# Altium schematic sheet FMU MCU.SchDoc: FMU IO
size 420 x 297 mm; CheckedBy: Le Huynh Phat Tai; DrawnBy: Le Huynh Phat Tai; Engineer: Le Huynh Phat Tai; SheetNumber: 1; SheetTotal: 5
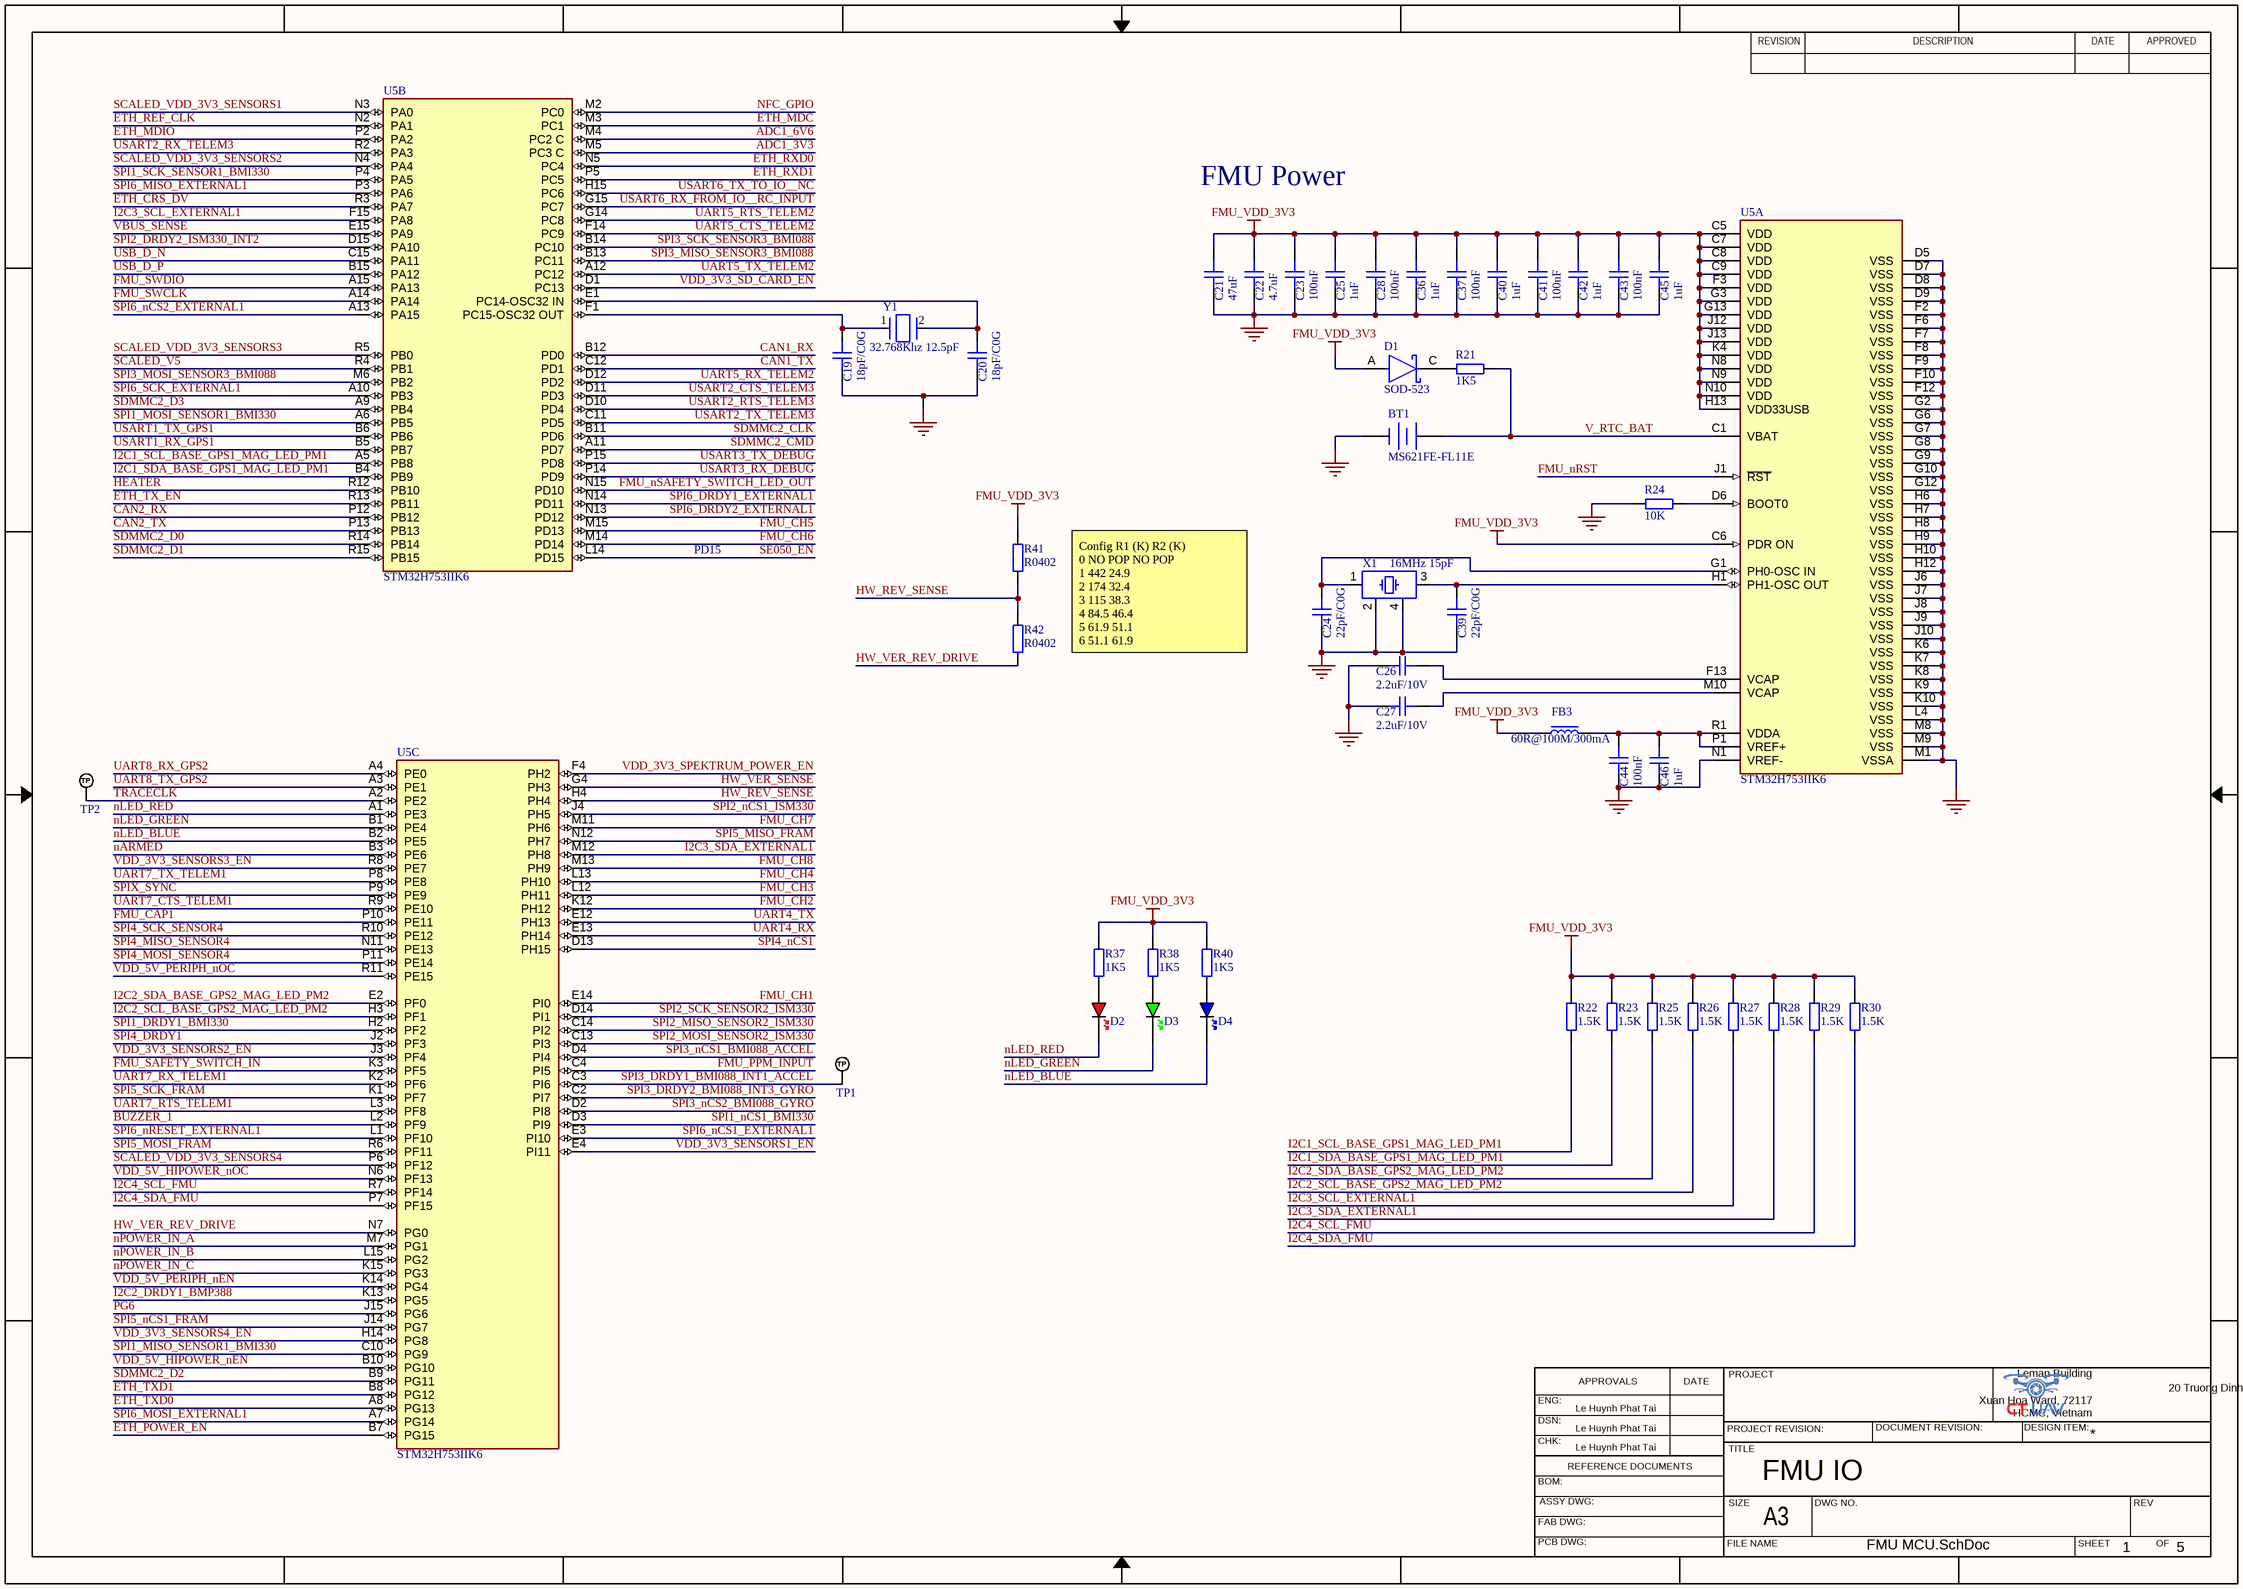
[diagram p0: FMU MCU.SchDoc]

## Parts
BT1  MS621FE-FL11E  [MS621R]
C19  18pF/C0G  [CAPC1005X05N]
C20  18pF/C0G  [CAPC1005X05N]
C21  47uF  [CAPC2012X14N]
C22  4.7uF  [CAPC1608X10N]
C23  100nF  [CAPC1005X05N]
C24  22pF/C0G  [CAPC1005X05N]
C25  1uF  [CAPC1005X05N]
C26  2.2uF/10V  [CAPC1608X10N]
C27  2.2uF/10V  [CAPC1608X10N]
C28  100nF  [CAPC1005X05N]
C36  1uF  [CAPC1005X05N]
C37  100nF  [CAPC1005X05N]
C39  22pF/C0G  [CAPC1005X05N]
C40  1uF  [CAPC1005X05N]
C41  100nF  [CAPC1005X05N]
C42  1uF  [CAPC1005X05N]
C43  100nF  [CAPC1005X05N]
C44  100nF  [CAPC1005X05N]
C45  1uF  [CAPC1005X05N]
C46  1uF  [CAPC1005X05N]
D1  SOD-523  [SODFL160X70-2N]
D2  RED  [LED_0603_RED]  (value not drawn)
D3  GREEN  [LED_0603_GREEN]  (value not drawn)
D4  BLUE  [LED_0603_BLUE]  (value not drawn)
FB3  60R@100M/300mA  [INDC1005X06N]
R21  1K5  [RESC1005X04N]
R22  1.5K  [RESC1005X04N]
R23  1.5K  [RESC1005X04N]
R24  10K  [RESC1005X04N]
R25  1.5K  [RESC1005X04N]
R26  1.5K  [RESC1005X04N]
R27  1.5K  [RESC1005X04N]
R28  1.5K  [RESC1005X04N]
R29  1.5K  [RESC1005X04N]
R30  1.5K  [RESC1005X04N]
R37  1K5  [RESC1005X04N]
R38  1K5  [RESC1005X04N]
R40  1K5  [RESC1005X04N]
R41  R0402  [RESC1005X04N]
R42  R0402  [RESC1005X04N]
TP1  TP_NOBOM  [PAD_RND_1MM]  (value not drawn)  (no BOM)
TP2  TP_NOBOM  [PAD_RND_1MM]  (value not drawn)  (no BOM)
U5  STM32H753IIK6  [BGA176C65P15X15_1000X1000X60N]  (parts A,B,C of 3)
X1  16MHz 15pF  [OSCCC320X250X80]
Y1  32.768Khz 12.5pF  [XTAL3215X80N-2N]

## Nets
FMU_VDD_3V3: C21.2 C22.2 C23.2 C25.2 C28.2 C36.2 C37.2 C40.2 C41.2 C42.2 C43.2 C45.2 D1.A FB3.1 R22.2 R23.2 R25.2 R26.2 R27.2 R28.2 R29.2 R30.2 R37.1 R38.1 R40.1 R41.1 U5.C5(VDD) U5.C6(PDR_ON) U5.C7(VDD) U5.C8(VDD) U5.C9(VDD) U5.F3(VDD) U5.G3(VDD) U5.G13(VDD) U5.H13(VDD33USB) U5.J12(VDD) U5.J13(VDD) U5.K4(VDD) U5.N8(VDD) U5.N9(VDD) U5.N10(VDD)
GND: BT1.2(-) C19.1 C20.1 C21.1 C22.1 C23.1 C24.1 C25.1 C26.2 C27.1 C28.1 C36.1 C37.1 C39.1 C40.1 C41.1 C42.1 C43.1 C44.1 C45.1 C46.1 R24.1 U5.D5(VSS) U5.D7(VSS) U5.D8(VSS) U5.D9(VSS) U5.F2(VSS) U5.F6(VSS) U5.F7(VSS) U5.F8(VSS) U5.F9(VSS) U5.F10(VSS) U5.F12(VSS) U5.G2(VSS) U5.G6(VSS) U5.G7(VSS) U5.G8(VSS) U5.G9(VSS) U5.G10(VSS) U5.G12(VSS) U5.H6(VSS) U5.H7(VSS) U5.H8(VSS) U5.H9(VSS) U5.H10(VSS) U5.H12(VSS) U5.J6(VSS) U5.J7(VSS) U5.J8(VSS) U5.J9(VSS) U5.J10(VSS) U5.K6(VSS) U5.K7(VSS) U5.K8(VSS) U5.K9(VSS) U5.K10(VSS) U5.L4(VSS) U5.M1(VSSA) U5.M8(VSS) U5.M9(VSS) U5.N1(VREF-) X1.2 X1.4
ADC1_3V3: U5.M5(PC3_C)
ADC1_6V6: U5.M4(PC2_C)
BUZZER_1: U5.L2(PF9)
CAN1_RX: U5.B12(PD0)
CAN1_TX: U5.C12(PD1)
CAN2_RX: U5.P12(PB12)
CAN2_TX: U5.P13(PB13)
ETH_CRS_DV: U5.R3(PA7)
ETH_MDC: U5.M3(PC1)
ETH_MDIO: U5.P2(PA2)
ETH_POWER_EN: U5.B7(PG15)
ETH_REF_CLK: U5.N2(PA1)
ETH_RXD0: U5.N5(PC4)
ETH_RXD1: U5.P5(PC5)
ETH_TX_EN: U5.R13(PB11)
ETH_TXD0: U5.A8(PG13)
ETH_TXD1: U5.B8(PG12)
FMU_CAP1: U5.P10(PE11)
FMU_CH1: U5.E14(PI0)
FMU_CH2: U5.K12(PH12)
FMU_CH3: U5.L12(PH11)
FMU_CH4: U5.L13(PH10)
FMU_CH5: U5.M15(PD13)
FMU_CH6: U5.M14(PD14)
FMU_CH7: U5.M11(PH6)
FMU_CH8: U5.M13(PH9)
FMU_nRST: U5.J1(~{RST})
FMU_nSAFETY_SWITCH_LED_OUT: U5.N15(PD10)
FMU_PPM_INPUT: U5.C4(PI5)
FMU_SAFETY_SWITCH_IN: U5.K3(PF5)
FMU_SWCLK: U5.A14(PA14)
FMU_SWDIO: U5.A15(PA13)
HEATER: U5.R12(PB10)
HW_REV_SENSE: R41.2 R42.1 U5.H4(PH4)
HW_VER_REV_DRIVE: R42.2 U5.N7(PG0)
HW_VER_SENSE: U5.G4(PH3)
I2C1_SCL_BASE_GPS1_MAG_LED_PM1: R22.1 U5.A5(PB8)
I2C1_SDA_BASE_GPS1_MAG_LED_PM1: R23.1 U5.B4(PB9)
I2C2_DRDY1_BMP388: U5.K13(PG5)
I2C2_SCL_BASE_GPS2_MAG_LED_PM2: R26.1 U5.H3(PF1)
I2C2_SDA_BASE_GPS2_MAG_LED_PM2: R25.1 U5.E2(PF0)
I2C3_SCL_EXTERNAL1: R27.1 U5.F15(PA8)
I2C3_SDA_EXTERNAL1: R28.1 U5.M12(PH8)
I2C4_SCL_FMU: R29.1 U5.R7(PF14)
I2C4_SDA_FMU: R30.1 U5.P7(PF15)
nARMED: U5.B3(PE6)
NFC_GPIO: U5.M2(PC0)
nLED_BLUE: D4.K U5.B2(PE5)
nLED_GREEN: D3.K U5.B1(PE4)
nLED_RED: D2.K U5.A1(PE3)
nPOWER_IN_A: U5.M7(PG1)
nPOWER_IN_B: U5.L15(PG2)
nPOWER_IN_C: U5.K15(PG3)
PG6: U5.J15(PG6)
SCALED_V5: U5.R4(PB1)
SCALED_VDD_3V3_SENSORS1: U5.N3(PA0)
SCALED_VDD_3V3_SENSORS2: U5.N4(PA4)
SCALED_VDD_3V3_SENSORS3: U5.R5(PB0)
SCALED_VDD_3V3_SENSORS4: U5.P6(PF12)
SDMMC2_CLK: U5.B11(PD6)
SDMMC2_CMD: U5.A11(PD7)
SDMMC2_D0: U5.R14(PB14)
SDMMC2_D1: U5.R15(PB15)
SDMMC2_D2: U5.B9(PG11)
SDMMC2_D3: U5.A9(PB4)
SE050_EN: U5.L14(PD15)
SPI1_DRDY1_BMI330: U5.H2(PF2)
SPI1_MISO_SENSOR1_BMI330: U5.C10(PG9)
SPI1_MOSI_SENSOR1_BMI330: U5.A6(PB5)
SPI1_nCS1_BMI330: U5.D3(PI9)
SPI1_SCK_SENSOR1_BMI330: U5.P4(PA5)
SPI2_DRDY2_ISM330_INT2: U5.D15(PA10)
SPI2_MISO_SENSOR2_ISM330: U5.C14(PI2)
SPI2_MOSI_SENSOR2_ISM330: U5.C13(PI3)
SPI2_nCS1_ISM330: U5.J4(PH5)
SPI2_SCK_SENSOR2_ISM330: U5.D14(PI1)
SPI3_DRDY1_BMI088_INT1_ACCEL: TP1.1(TP) U5.C3(PI6)
SPI3_DRDY2_BMI088_INT3_GYRO: U5.C2(PI7)
SPI3_MISO_SENSOR3_BMI088: U5.B13(PC11)
SPI3_MOSI_SENSOR3_BMI088: U5.M6(PB2)
SPI3_nCS1_BMI088_ACCEL: U5.D4(PI4)
SPI3_nCS2_BMI088_GYRO: U5.D2(PI8)
SPI3_SCK_SENSOR3_BMI088: U5.B14(PC10)
SPI4_DRDY1: U5.J2(PF3)
SPI4_MISO_SENSOR4: U5.N11(PE13)
SPI4_MOSI_SENSOR4: U5.P11(PE14)
SPI4_nCS1: U5.D13(PH15)
SPI4_SCK_SENSOR4: U5.R10(PE12)
SPI5_MISO_FRAM: U5.N12(PH7)
SPI5_MOSI_FRAM: U5.R6(PF11)
SPI5_nCS1_FRAM: U5.J14(PG7)
SPI5_SCK_FRAM: U5.K1(PF7)
SPI6_DRDY1_EXTERNAL1: U5.N14(PD11)
SPI6_DRDY2_EXTERNAL1: U5.N13(PD12)
SPI6_MISO_EXTERNAL1: U5.P3(PA6)
SPI6_MOSI_EXTERNAL1: U5.A7(PG14)
SPI6_nCS1_EXTERNAL1: U5.E3(PI10)
SPI6_nCS2_EXTERNAL1: U5.A13(PA15)
SPI6_nRESET_EXTERNAL1: U5.L1(PF10)
SPI6_SCK_EXTERNAL1: U5.A10(PB3)
SPIX_SYNC: U5.P9(PE9)
TRACECLK: TP2.1(TP) U5.A2(PE2)
UART4_RX: U5.E13(PH14)
UART4_TX: U5.E12(PH13)
UART5_CTS_TELEM2: U5.F14(PC9)
UART5_RTS_TELEM2: U5.G14(PC8)
UART5_RX_TELEM2: U5.D12(PD2)
UART5_TX_TELEM2: U5.A12(PC12)
UART7_CTS_TELEM1: U5.R9(PE10)
UART7_RTS_TELEM1: U5.L3(PF8)
UART7_RX_TELEM1: U5.K2(PF6)
UART7_TX_TELEM1: U5.P8(PE8)
UART8_RX_GPS2: U5.A4(PE0)
UART8_TX_GPS2: U5.A3(PE1)
USART1_RX_GPS1: U5.B5(PB7)
USART1_TX_GPS1: U5.B6(PB6)
USART2_CTS_TELEM3: U5.D11(PD3)
USART2_RTS_TELEM3: U5.D10(PD4)
USART2_RX_TELEM3: U5.R2(PA3)
USART2_TX_TELEM3: U5.C11(PD5)
USART3_RX_DEBUG: U5.P14(PD9)
USART3_TX_DEBUG: U5.P15(PD8)
USART6_RX_FROM_IO__RC_INPUT: U5.G15(PC7)
USART6_TX_TO_IO__NC: U5.H15(PC6)
USB_D_N: U5.C15(PA11)
USB_D_P: U5.B15(PA12)
V_RTC_BAT: BT1.1(+) R21.2 U5.C1(VBAT)
VBUS_SENSE: U5.E15(PA9)
VDD_3V3_SD_CARD_EN: U5.D1(PC13)
VDD_3V3_SENSORS1_EN: U5.E4(PI11)
VDD_3V3_SENSORS2_EN: U5.J3(PF4)
VDD_3V3_SENSORS3_EN: U5.R8(PE7)
VDD_3V3_SENSORS4_EN: U5.H14(PG8)
VDD_3V3_SPEKTRUM_POWER_EN: U5.F4(PH2)
VDD_5V_HIPOWER_nEN: U5.B10(PG10)
VDD_5V_HIPOWER_nOC: U5.N6(PF13)
VDD_5V_PERIPH_nEN: U5.K14(PG4)
VDD_5V_PERIPH_nOC: U5.R11(PE15)
NetC19_2: C19.2 U5.F1(PC15-OSC32_OUT) Y1.1
NetC20_2: C20.2 U5.E1(PC14-OSC32_IN) Y1.2
NetC24_2: C24.2 U5.G1(PH0-OSC_IN) X1.1
NetC26_1: C26.1 U5.F13(VCAP)
NetC27_2: C27.2 U5.M10(VCAP)
NetC39_2: C39.2 U5.H1(PH1-OSC_OUT) X1.3
NetC44_2: C44.2 C46.2 FB3.2 U5.P1(VREF+) U5.R1(VDDA)
NetD1_C: D1.C R21.1
NetD2_A: D2.A R37.2
NetD3_A: D3.A R38.2
NetD4_A: D4.A R40.2
NetR24_2: R24.2 U5.D6(BOOT0)

## Notes on the sheet
- FMU Power
- PD15
- Config	R1 (K)	R2 (K)
  0	NO POP	NO POP
  1	442	24.9
  2	174	32.4
  3	115	38.3
  4	84.5	46.4
  5	61.9	51.1
  6	51.1	61.9
  7	46.4	84.5
  8	38.3	115
  9	32.4	174
  10	24.9	442
- REVISION
- DESCRIPTION
- DATE
- APPROVED
- ENG:
- APPROVALS
- PROJECT
- Xuan Hoa Ward, 72117
- Leman Building
- 20 Truong Dinh
- DSN:
- CHK:
- REFERENCE DOCUMENTS
- PROJECT REVISION:
- TITLE
- DOCUMENT REVISION:
- DESIGN ITEM:
- HCMC, Vietnam
- BOM:
- FAB DWG:
- PCB DWG:
- ASSY DWG:
- FILE NAME
- SIZE
- A3
- DWG NO.
- SHEET
- REV
- OF

## Library data of the parts
BT1 = BATTERY_SINGLE-2: MS Lihium Rechargeable Battery, 3 V, -20 to 60 degC, Tray; Manufacturer: SeikoInstruments; Brand: SeikoInstrumentsMicroEnergy; Output Voltage: 3V; Capacity: 5.5mAh; Chemistry: Lithium; Battery Size: 621; Unit Weight: 0.008113oz; Datasheet URL: http://datasheet.octopart.com/MS621FE-FL11E-Seiko-datasheet-5320152.pdf; Rechargeable/Non-Rechargeable: Rechargeable; Orientation: Vertical; Height: 2.1mm; Series: MS; Datasheet Version: Jan-08; Type: CoinCellBatterywithLeads; Diameter: 6.8mm; Mounting Style: WithLeads; Product Category: CoinCellBattery; Termination Style: ThroughHole; Packaging: Tray; Manufacturer URL: http://www.sii.co.jp/en/; RoHS: NotApplicable; Factory Pack Quantity: 100
C19 C20 C23-C25 C28 C36 C37 C39-C46 = CAP_0402: Capacitor SMD 0402; Manufacturer: *; Manufacturer Part Number: *; Distributor Link: *; LCSC: *; Rating: *; Dielectric: *
C21 = CAP_0805: Capacitor SMD 0805; Manufacturer: *; Manufacturer Part Number: *; Distributor Link: *; LCSC: *; Rating: *; Dielectric: *
C22 C26 C27 = CAP_0603: Capacitor SMD 0603; Manufacturer: *; Manufacturer Part Number: *; Distributor Link: *; LCSC: *; Rating: *; Dielectric: *
D1 = 1d6ec82d83fb6aee721767c19dac4b9: DIODE SCHOTTKY SOD523; Manufacturer: Diodes Inc.; Manufacturer Part Number: SDM20U30-7; Automotive Grade: Grade 1; Forward Current: 200mA; Max Surge Forward Current: 1A; Max Junction Temp: +125°C; Reverse Voltage: 30V; Peak Reverse Current: 150uA; ComponentLink2Description: Datasheet; Automotive: Yes; Octopart: https://octopart.com/sdm20u30-7-diodes+inc.-333874; Device Class L1: Discrete Semiconductors; Footprint Url: https://www.diodes.com/assets/Package-Files/SOD523.pdf; Device Class L3: Schottky Diodes; Height: 0.65mm; Lead Free: Yes; Mouser Description: SDM20U30 Series 20 V 200 mA Surface Mount Schottky Barrier Diode - SOD-523; Temperature Range Low: -65°C; Digikey Description: DIODE SCHOTTKY 30V 200MA SOD523; Category: Diode; RoHS: TRUE; Temperature Range High: +125°C; ComponentLink2URL: https://www.diodes.com/assets/Datasheets/ds30397.pdf; Device Class L2: Diodes; Max Repetitive Reverse Voltage: 30V; Temperature: -65°C to +125°C; Package: SOD523
D2 = LED_0603_RED: LED 0603 RED SMD
D3 = LED_0603_GREEN: LED 0603 GREEN SMD
D4 = LED_0603_BLUE: LED 0603 BLUE SMD
FB3 = FB_0402: Ferrite Bead SMD 0402; Manufacturer: *; Manufacturer Part Number: *; Distributor Link: *; LCSC: *
R21-R30 R37 R38 R40-R42 = RES_0402: Resistor SMD 0402; Manufacturer: *; Manufacturer Part Number: *; Distributor Link: *; LCSC: *
TP1 TP2 = TEST_POINT_RND_1MM: Test Point Round 1mm (NO BOM)
U5 = f2632c7e739cd93bf56a941e5fc9246: UFBGA 10X10X0.6 176+; Manufacturer: STMicroelectronics; Number Of I/Os: 140; Frequency: 400MHz; Data Bus Width: 32bits; Number Of Uart Channels: 9; Number Of Spi Channels: 6; Number Of Timers/Counters: 20; Min Supply Voltage: 1.62V; Memory Size: 2MBytes; Max Junction Temp: +125°C; Number Of I2C Channels: 4; Number Of Pwm Channels: 42; Core Architecture: ARM Cortex-M7; Number Of Adc Channels: 36; Number Of A/D Converters: 3; Max Supply Voltage: 3.6V; Number Of Usb Channels: 2; Interface: I2C,SPI,UART,USART,CAN,USB,LIN,IrDA,Ethernet,I2S,Other; Memory Type: FLASH; Number Of Cores: 1; Ram Size: 1MBytes; Category: IC; Automotive: No; Device Class L1: Integrated Circuits (ICs); ComponentLink2URL: https://www.st.com/resource/en/datasheet/stm32h753ii.pdf; Manufacturer Part Number: STM32H753IIK6; Device Class L2: Embedded Processors and Controllers; Ambient Temperature Range Low: -40°C; ComponentLink2Description: Datasheet; Temperature Range High: +125°C; Temperature Range Low: -40°C; Ipc Land Pattern Name: BGA225N65P15X15_1000X1000X60; Lead Free: Yes; Ambient Temperature Range High: +85°C; Height: 0.6mm; Package: UFBGA176+25-A0E7; Mouser Description: MCU 32-Bit STM32 ARM Cortex M7 RISC 2MB Flash 1.8V/2.5V/3.3V 176-Pin UFBGA Tray; Device Class L3: Microcontrollers; Temperature: -40°C to +125°C; Digikey Description: UFBGA 10X10X0.6 176+; Octopart: https://octopart.com/stm32h753iik6-stmicroelectronics-84735750; Number Of Ethernet Channels: 1; RoHS: TRUE
X1 = TSX-3225_24.0000MF15X-AC: Crystal SMD 24MHz 10PPM 7pF 3225; Manufacturer: Epson; Manufacturer Part Number: TSX-3225 24.0000MF15X-AC
Y1 = c23a69dc6c9e2f18f2079038eb95dd1: NX3215SA-32.768K-STD-MUA-14 Parallel - Fundamental Quartz Crystal, 0.032768MHz Nom; NexarPartId: 22488149; ESR (Equivalent Series Resistance): 70kΩ; Frequency Tolerance: 0.002%; Load Capacitance: 6pF; Width: 1.4986mm; Length: 3.2004mm; RoHS: Compliant; Case/Package: SMD/SMT; Mount: Surface Mount; Height: 889µm; Number of Pins: 2; Packaging: Tape & Reel (TR); Max Operating Temperature: 85°C; Frequency: 32.768kHz; Min Operating Temperature: -40°C